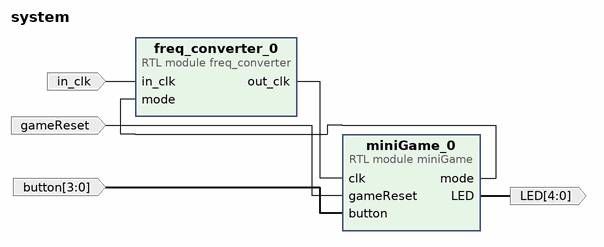
[diagram p0: block diagram of the top level]
# Vivado block design system, xc7z010clg400-1, Vivado 2019.1
create_bd_design system

create_bd_port -dir I -type clk in_clk
create_bd_port -dir I gameReset
create_bd_port -dir O -from 4 -to 0 LED
create_bd_port -dir I -from 3 -to 0 button

create_bd_cell -type module -reference freq_converter freq_converter_0
create_bd_cell -type module -reference miniGame miniGame_0

# ---- connections ----

connect_bd_net [get_bd_pins freq_converter_0/out_clk] [get_bd_pins miniGame_0/clk]
connect_bd_net [get_bd_pins miniGame_0/mode] [get_bd_pins freq_converter_0/mode]
connect_bd_net -net in_clk_0_1 [get_bd_ports in_clk] [get_bd_pins freq_converter_0/in_clk]
connect_bd_net -net gameReset_0_1 [get_bd_ports gameReset] [get_bd_pins miniGame_0/gameReset]
connect_bd_net [get_bd_pins miniGame_0/LED] [get_bd_ports LED]
connect_bd_net -net button_0_1 [get_bd_ports button] [get_bd_pins miniGame_0/button]

validate_bd_design
save_bd_design
